# EasyEDA Pro project wzh2814685-voltpen_v0-5-3f4d7379.epro, board C245支架_板厚0.8
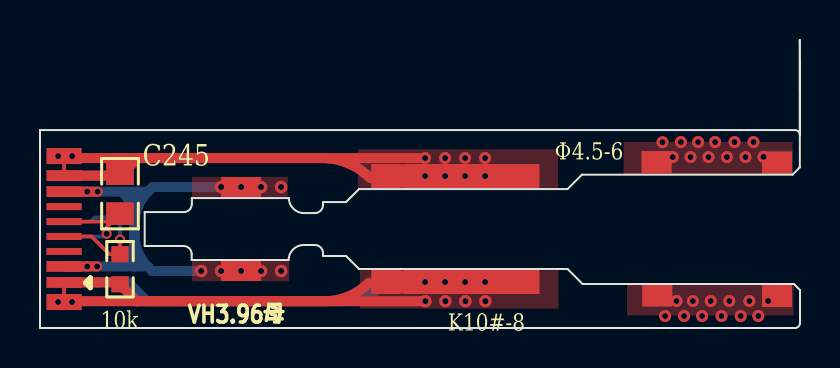
[diagram p11: board, top side]
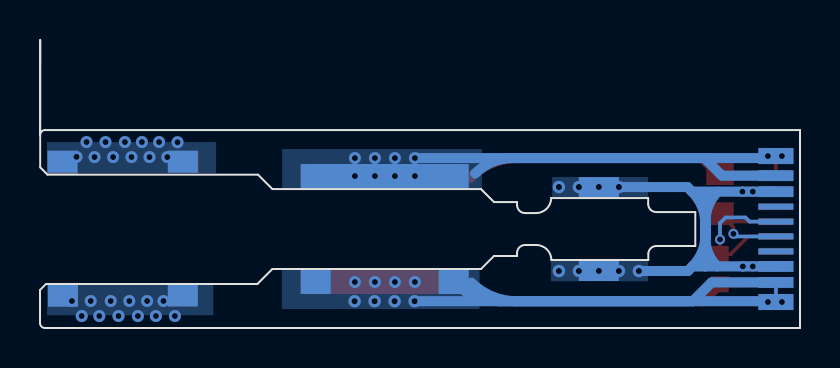
[diagram p12: board, bottom side, seen from below]

Outline 38 x 14.41 mm; copper layers: Top Layer, Bottom Layer. Coordinates in mm from the lower left corner of the outline.
Outline path: 38,9.65 arc(37.93,9.83) 37.75,9.9 0,9.9 0,0 37.75,0 arc(37.93,0.07) 38,0.25 38,1.65 ; 38,9.65 37.99,14.41 37.99,8.04 37.62,7.67 27.1,7.67 26.38,6.95 15.95,6.95 15.3,6.3 14.15,6.3 14.15,6.15 arc(14.03,5.87) 13.75,5.75 13.19,5.75 arc(12.66,5.97) 12.44,6.5 7.59,6.5 7.59,6.2 arc(7.47,5.92) 7.19,5.8 5.23,5.8 5.24,4.1 7.18,4.1 arc(7.47,3.98) 7.58,3.7 7.58,3.4 12.43,3.4 arc(12.65,3.93) 13.18,4.15 13.75,4.15 arc(14.03,4.03) 14.15,3.75 14.15,3.6 15.3,3.6 15.95,2.95 26.38,2.95 27.13,2.2 37.7,2.2 38,1.9 38,1.64
Stack: Top Layer 0.035mm / Dielectric1 1.51mm FR4 er 4.5 / Bottom Layer 0.035mm

## Design rules (mm)
spacing safeClearance (default): track to track 0.152, other pairs 0.152 to 0.3
spacing Plane_innerPlane: track to track 0.152, other pairs 0.152 to 0.3
spacing Copper_copperRegion: track to track 0.152, other pairs 0.152 to 0.3
spacing Copper_gge4905: track to track 0.152, other pairs 0.152 to 0.3
spacing Copper_gge4899: track to track 0.152, other pairs 0.152 to 0.3
track width trackWidth (default): min 0.127, default 0.254, max 2.54
differential pair differentialPair (default): width min 0.127, default 0.254, max 2.54; gap min 0.152, default 0.152

## Placement (name value [footprint] x y rotation side)
NOREF  -  [Pad_e71]  10.06 2.85 0 top
NOREF#2  -  [Pad_e66]  30.86 1.63 0 top
NOREF#3  -  [Pad_e63]  17.31 7.6 0 top
NOREF#4  -  [Pad_e61]  10.06 7.05 0 top
NOREF#5  -  [Pad_e75]  24.22 7.6 0 top
NOREF#6  -  [Pad_e65]  24.22 7.6 0 top
NOREF#7  -  [Pad_e69]  30.83 8.3 0 top
NOREF#8  -  [Pad_e70]  10.06 7.05 0 top
NOREF#9  -  [Pad_e62]  17.31 2.3 0 top
NOREF#10  -  [Pad_e64]  24.22 2.3 0 top
NOREF#11  -  [Pad_e67]  36.85 1.6 0 top
NOREF#12  -  [Pad_e74]  24.22 2.3 0 top
NOREF#13  -  [Pad_e72]  17.31 2.3 0 top
NOREF#14  -  [Pad_e68]  36.85 8.27 0 top
NOREF#15  -  [Pad_e77]  30.86 8.32 0 top
NOREF#16  -  [Pad_e76]  30.86 1.63 0 top
NOREF#17  -  [Pad_e73]  17.31 7.6 0 top
NOREF#18  -  [Pad_e78]  36.85 1.62 0 top
NOREF#19  -  [Pad_e60]  10.06 2.85 0 top
NOREF#20  -  [Pad_e79]  36.88 8.32 0 top
R1  -  [R0603]  4 2.94 90 top
S1  -  [R0805]  4 6.72 270 top
USB4  TYPE-C-16简化 公头  [TYPE-C-16P简化 公头]  0 4.95 90 top

## Footprints (pads in the part's own frame, mm; a bottom-side part is the same pattern mirrored in y, then rotated)
Pad_e60
  custom 0x0 smd: (0,0)
Pad_e61
  custom 0x0 smd: (0,0)
Pad_e62
  custom 0x0 smd: (0,0)
Pad_e63
  custom 0x0 smd: (0,0)
Pad_e64
  custom 0x0 smd: (0,0)
Pad_e65
  custom 0x0 smd: (0,0)
Pad_e66
  custom 0x0 smd: (0,0)
Pad_e67
  custom 1.5x1.1 smd: (0,0)
Pad_e68
  custom 1.5x1.1 smd: (0,0)
Pad_e69
  custom 1.5x1.1 smd: (0,0)
Pad_e70
  custom 0x0 smd far side: (0,0)
Pad_e71
  custom 0x0 smd far side: (0,0)
Pad_e72
  custom 0x0 smd far side: (0,0)
Pad_e73
  custom 0x0 smd far side: (0,0)
Pad_e74
  custom 0x0 smd far side: (0,0)
Pad_e75
  custom 0x0 smd far side: (0,0)
Pad_e76
  custom 0x0 smd far side: (0,0)
Pad_e77
  custom 1.5x1.1 smd far side: (0,0)
Pad_e78
  custom 1.5x1.1 smd far side: (0,0)
Pad_e79
  custom 1.5x1.1 smd far side: VCT1(0,0)
R0603
  rect 0.806x0.864 smd: 1(-0.753,0) 2(0.753,0)
R0805
  rect 1.133x1.377 smd: 1(-1,0) 2(1,0)
TYPE-C-16P简化 公头
  rect 0.8x1.75 smd: 0(-3.65,-1.2) 0(3.65,-1.2)
  rect 0.8x1.75 smd far side: 0(-3.65,-1.2) 0(3.65,-1.2)
  rect 0.54x1.75 smd: A1(-2.67,-1.2) A4(-1.87,-1.2) A9(1.87,-1.2) A12(2.67,-1.2)
  rect 0.35x1.75 smd: A5(-1.12,-1.2) A6(-0.37,-1.2) A7(0.37,-1.2) A8(1.12,-1.2)
  rect 0.54x1.75 smd far side: B1(2.67,-1.2) B4(1.87,-1.2) B9(-1.87,-1.2) B12(-2.67,-1.2)
  rect 0.3x1.75 smd far side: B5(1.12,-1.2) B6(0.37,-1.2) B7(-0.37,-1.2) B8(-1.12,-1.2)

## Nets
GND: NOREF#2. NOREF#3. NOREF#5. NOREF#6. NOREF#7. NOREF#9. NOREF#10. NOREF#11. NOREF#12. NOREF#13. NOREF#14. NOREF#15. NOREF#16. NOREF#17. NOREF#18. NOREF#20.VCT1 R1.1 S1.1 USB4.0 USB4.A1 USB4.A12 USB4.B1 USB4.B12
H_ID: R1.2 USB4.A6 USB4.B6
SLP: S1.2 USB4.A7 USB4.B7
TEMP: NOREF. NOREF#4. NOREF#8. NOREF#19. USB4.A4 USB4.A9 USB4.B4 USB4.B9

Pads without a net: USB4 A5 A8 B5 B8

## Via types
v1: diameter 0.6, hole 0.3, Top Layer to Bottom Layer, 36 vias
v2: diameter 0.62, hole 0.31, Top Layer to Bottom Layer, 11 vias
v3: diameter 0.5, hole 0.3, Top Layer to Bottom Layer, 10 vias
v4: diameter 0.61, hole 0.305, Top Layer to Bottom Layer, 2 vias

## Routing (per net, layer and track width the routed paths; a pad name or vN(x,y) marks a point on that pad's centre or on a via; arc(x,y) is an arc through that point)
GND: length 169.7
  Top Layer w0.18: 19.23,1.3 v2(19.27,1.34) ; USB4.A1 USB4.0 ; USB4.A12 USB4.0 ; 19.16,8.6 v1(19.25,8.5)
  Top Layer w0.5: 16.51,7.5 arc(15.4,8.24) 14.09,8.5 4.89,8.5 ; 16.42,2.24 arc(15.42,1.57) 14.25,1.34 4.85,1.34 ; USB4.0 1.2,1.34 4.85,1.34 ; 4.85,1.34 R1.1 4,2.28 USB4.A1 ; 4.85,1.34 19.27,1.34 ; USB4.0 1.2,8.5 4.89,8.5 ; 4.89,8.5 4.11,7.72 4,7.72 4,7.62 USB4.A12 ; 4.89,8.5 v1(19.26,8.5)
  Top Layer w1.2: 24.21,7.6 20.26,7.6 ; 18.32,2.3 24.21,2.3 ; 18.32,7.6 20.25,7.6
  Bottom Layer w0.18: 19.23,1.3 v2(19.27,1.34) ; USB4.A1 USB4.0
  Bottom Layer w0.5: 16.24,7.73 arc(15.39,8.3) 14.38,8.5 4.78,8.5 ; 16.43,2.27 arc(15.4,1.58) 14.19,1.34 5.61,1.34 ; 17.31,2.3 arc(16.25,1.59) 15,1.34 5.36,1.34 ; 5.36,1.34 4.42,2.28 USB4.A1 ; 5.36,1.34 1.2,1.34 USB4.0 ; 5.36,1.34 19.27,1.34 ; 4.78,8.5 3.9,7.62 USB4.A12 ; 4.78,8.5 v1(19.26,8.5) ; 4.78,8.5 1.2,8.5 USB4.0
  Bottom Layer w1.2: 17.31,7.6 24.21,7.6
  vias: v1(19.25,7.6) v1(19.25,2.3) v1(20.25,8.5) v1(20.25,7.6) v1(20.25,2.3) v1(21.25,8.5) v1(21.25,7.6) v1(21.25,2.3) v1(22.25,8.5) v1(22.25,7.6) v1(22.25,2.3) v1(31.12,9.29) v1(31.25,0.6) v1(31.63,8.55) v1(31.82,1.35) v1(32.04,9.3) v1(32.21,0.6) v1(32.53,8.55) v1(32.65,1.35) v1(32.91,9.3) v1(33.1,0.6) v1(33.43,8.55) v1(33.53,1.35) v1(33.75,9.3) v1(34.07,0.6) v1(34.34,8.55) v1(34.47,1.35) v1(34.72,9.3) v1(35.03,0.6) v1(35.28,8.55) v1(35.47,1.35) v1(35.68,9.3) v1(35.91,0.6) v1(36.18,8.56) v1(36.41,1.35) v2(20.27,1.34) v2(21.27,1.34) v2(22.27,1.34) v3(0.91,8.6) v3(0.9,1.3) v3(1.61,8.6) v3(1.6,1.3)
H_ID: length 7.7
  Top Layer w0.18: 1.2,4.58 2.58,4.58 3.47,3.69 4,3.69 v3(4,4.43)
  Bottom Layer w0.18: v3(4,4.43) 4,5.25 3.72,5.53 2.73,5.53 2.52,5.32 1.2,5.32
SLP: length 6.4
  Top Layer w0.18: 3.33,4.71 3.33,5.04 S1.2 3.6,5.32 1.2,5.32
  Bottom Layer w0.18: 3.33,4.71 3.2,4.58 1.2,4.58
  vias: v3(3.33,4.71)
TEMP: length 34.1
  Top Layer w0.5: USB4.A9 v3(2.88,6.82) ; USB4.A4 v3(2.86,3.08)
  Bottom Layer w0.5: 4.11,6.82 arc(4.56,6.14) 4.72,5.34 4.72,3.08 ; 4.14,3.08 arc(4.58,3.73) 4.73,4.51 4.73,5.07 ; 5.4,6.82 arc(4.91,6.08) 4.73,5.21 4.73,3.08 ; 5.4,6.82 5.63,7.05 v2(9.06,7.05) ; 5.4,6.82 v3(2.88,6.82) USB4.A9 ; 5.38,3.08 arc(4.9,3.8) 4.73,4.64 4.73,5.26 ; 5.38,3.08 v3(2.86,3.08) USB4.A4 ; 5.38,3.08 5.61,2.85 v2(8.06,2.85) ; 4.73,6.75 4.73,3.15
  vias: v2(9.06,2.85) v2(11.06,7.05) v2(11.06,2.85) v2(12.06,7.05) v2(12.06,2.85) v3(2.36,6.82) v3(2.36,3.08) v4(10.06,7.05) v4(10.06,2.85)

## Copper pours and planes (outline as drawn; the poured copper is in the pictures)
GND on Top Layer: 16,2.89 25.93,2.89 25.93,0.97 16,0.97
GND on Top Layer: 15.89,8.94 25.91,8.94 25.91,7 15.89,7
GND on Top Layer: 29.35,2.25 37.68,2.25 37.68,0.63 29.35,0.63
GND on Top Layer: 29.19,9.31 37.62,9.31 37.62,7.67 29.19,7.67
GND on Bottom Layer: 15.91,8.95 25.89,8.95 25.89,6.97 15.91,6.97
GND on Bottom Layer: 29.2,9.3 37.66,9.3 37.66,7.73 29.2,7.73
GND on Bottom Layer: 29.34,2.22 37.65,2.22 37.65,0.64 29.34,0.64
GND on Bottom Layer: 16.02,2.9 25.91,2.9 25.91,0.95 16.02,0.95
TEMP on Top Layer: 7.6,7.56 12.39,7.56 12.39,6.55 7.6,6.55
TEMP on Top Layer: 7.59,3.39 12.46,3.39 12.46,2.34 7.59,2.34
TEMP on Bottom Layer: 7.61,7.55 12.39,7.55 12.39,6.55 7.61,6.55
TEMP on Bottom Layer: 7.59,3.39 12.46,3.39 12.46,2.34 7.59,2.34

## Text on the board
Top Silkscreen Layer: 10k | VH3.96母 | K10#-8 | Φ4.5-6 | C245
